# Altium project 14MV1.PrjPcb
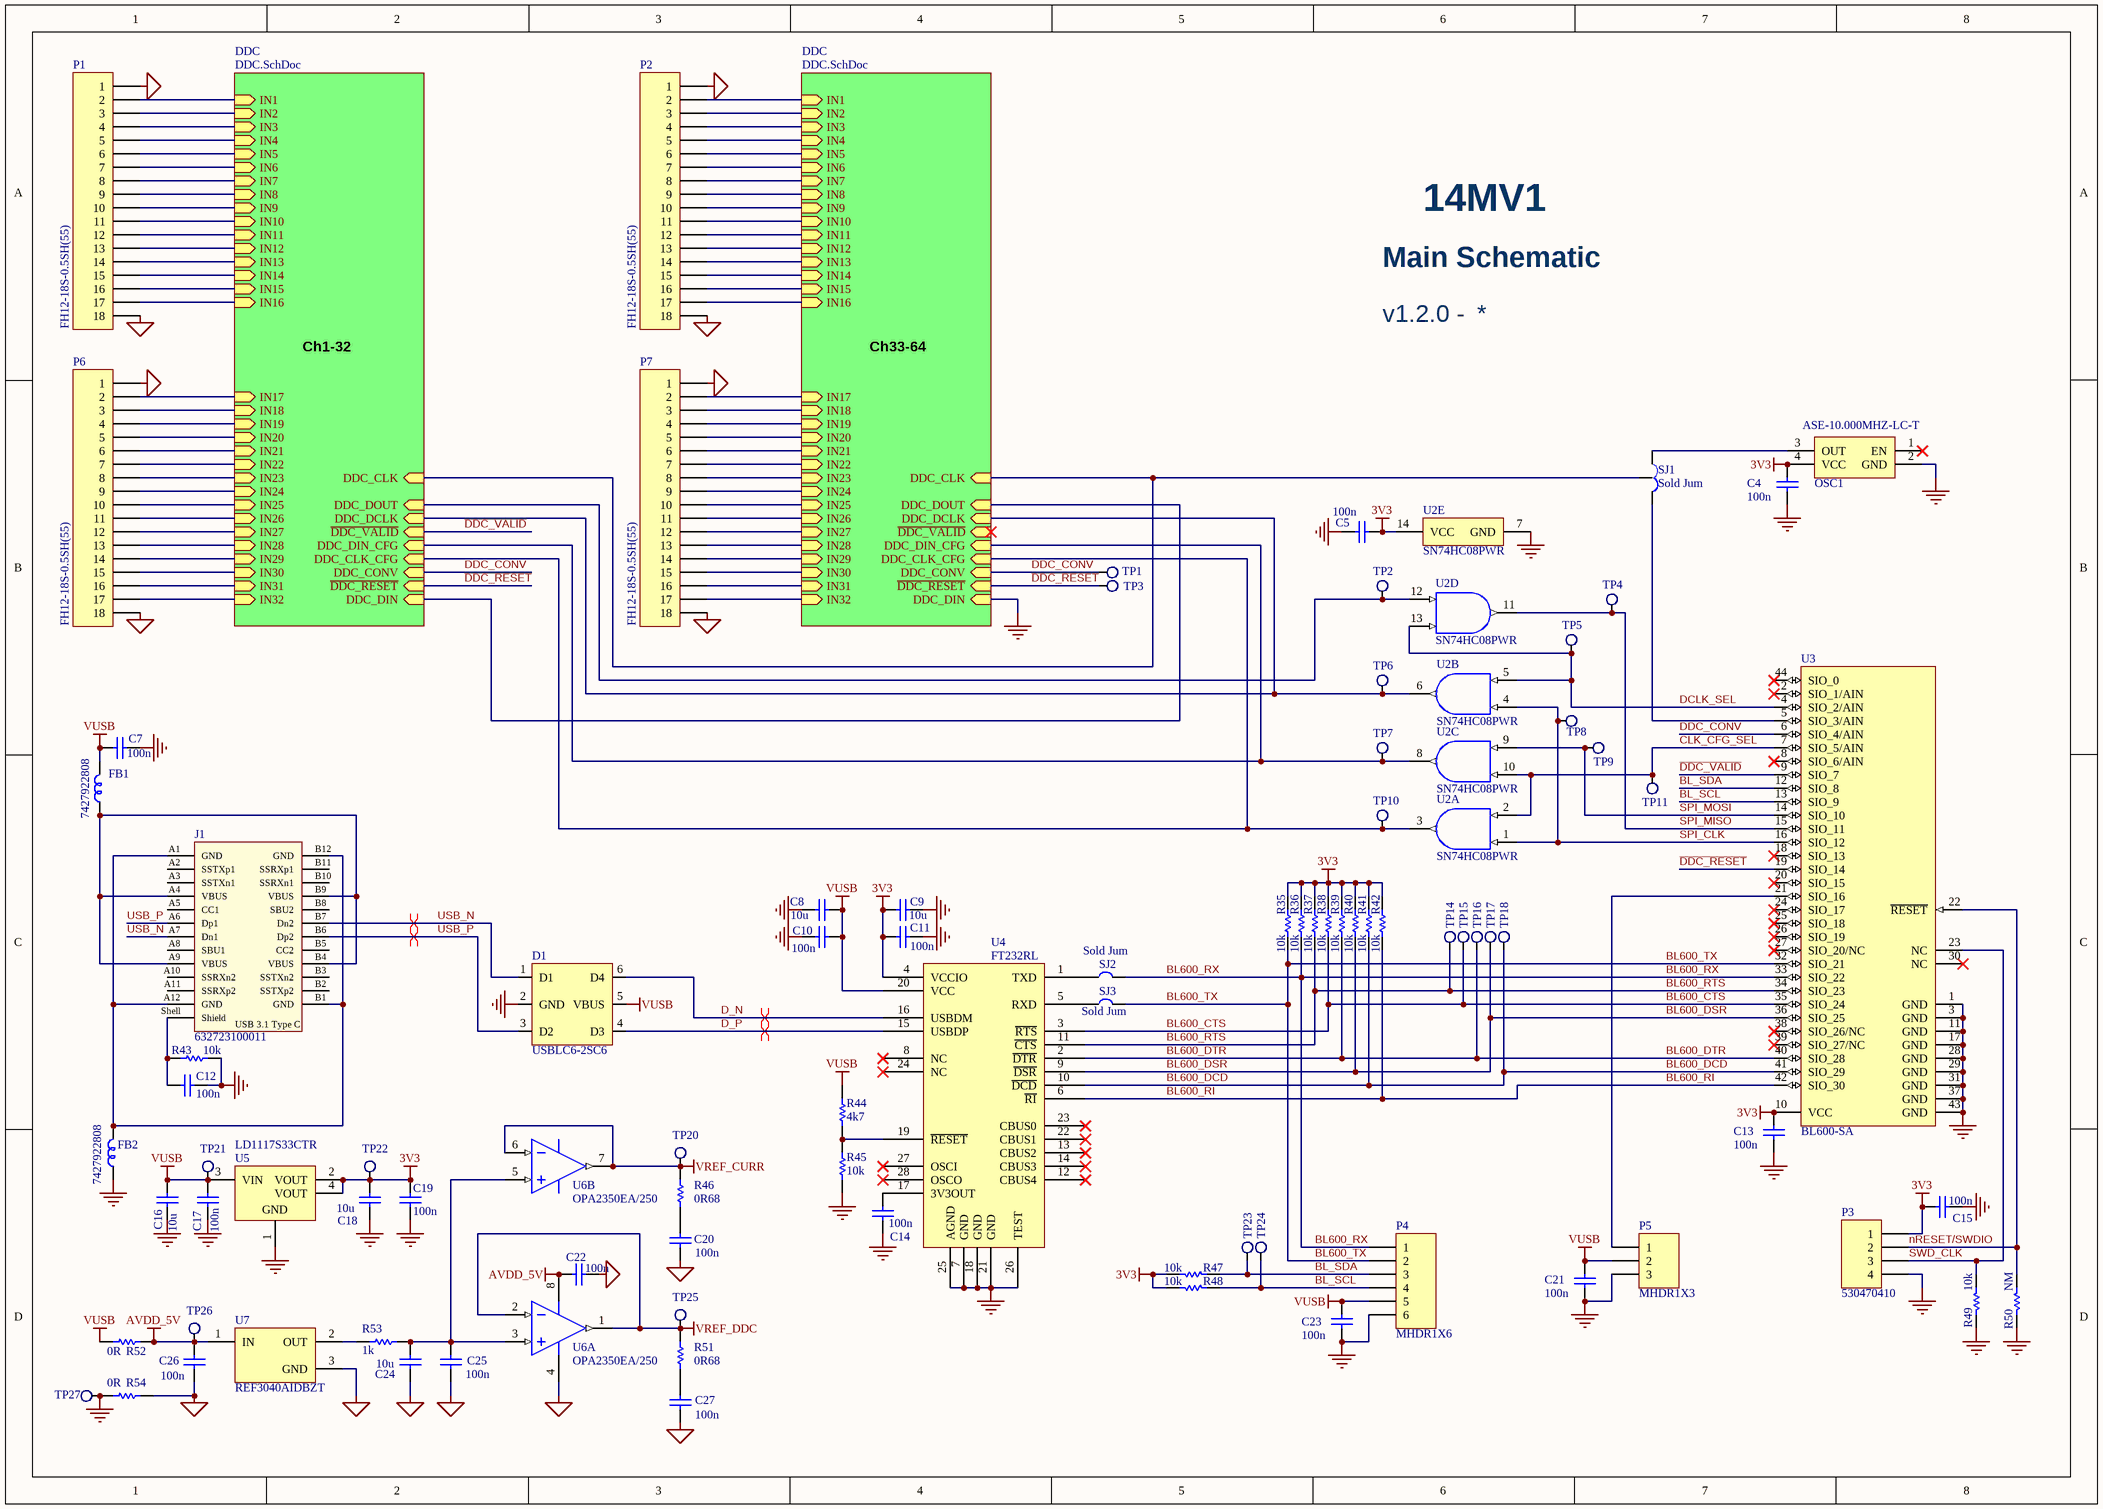
[diagram p0: 14MV1.SchDoc]
2 sheets, 166 parts. Net scope: hierarchical (ports join the sheet entries above them; power ports are global).
Board file: 14MV1.PcbDoc
Sheets:
  14MV1.SchDoc
    DDC = DDC.SchDoc
    DDC = DDC.SchDoc

## Sheet 14MV1.SchDoc
size A3

### Parts
C4  100n  [0402]
C5  100n  [0402]
C7  100n  [0402]
C8  10u  [0603]
C9  10u  [0603]
C10  100n  [0402]
C11  100n  [0402]
C12  100n  [0402]
C13  100n  [0402]
C14  100n  [0402]
C15  100n  [0402]
C16  10u  [0603]
C17  100n  [0402]
C18  10u  [0603]
C19  100n  [0402]
C20  100n  [0402]
C21  100n  [0402]
C22  100n  [0402]
C23  100n  [0402]
C24  10u  [0603]
C25  100n  [0402]
C26  100n  [0402]
C27  100n  [0402]
D1  USBLC6-2SC6  [SOT23-6]
FB1  7427922808  [0603]
FB2  7427922808  [0603]
J1  632723100011  [632723100011]
OSC1  ASE-10.000MHZ-LC-T  [XTAL_SMD3225]
P1  FH12-18S-0.5SH(55)  [FH12-18S-0.5SH(55)]
P2  FH12-18S-0.5SH(55)  [FH12-18S-0.5SH(55)]
P3  530470410  [MOLEX_4_V]
P4  MHDR1X6  [MHDR1X6]
P5  MHDR1X3  [MHDR1X3]
P6  FH12-18S-0.5SH(55)  [FH12-18S-0.5SH(55)]
P7  FH12-18S-0.5SH(55)  [FH12-18S-0.5SH(55)]
R35  10k  [0402]
R36  10k  [0402]
R37  10k  [0402]
R38  10k  [0402]
R39  10k  [0402]
R40  10k  [0402]
R41  10k  [0402]
R42  10k  [0402]
R43  10k  [0402]
R44  4k7  [0402]
R45  10k  [0402]
R46  0R68  [0402]
R47  10k  [0402]
R48  10k  [0402]
R49  10k  [0402]
R50  NM  [0402]
R51  0R68  [0402]
R52  0R  [0402]
R53  1k  [0402]
R54  0R  [0402]
SJ1  Sold Jum  [Solder_j2]
SJ2  Sold Jum  [Solder_j]
SJ3  Sold Jum  [Solder_j]
TP1  TestPoint  [PIAZZOLA]  (value not drawn)
TP2  TestPoint  [PIAZZOLA]  (value not drawn)
TP3  TestPoint  [PIAZZOLA]  (value not drawn)
TP4  TestPoint  [PIAZZOLA]  (value not drawn)
TP5  TestPoint  [PIAZZOLA]  (value not drawn)
TP6  TestPoint  [PIAZZOLA]  (value not drawn)
TP7  TestPoint  [PIAZZOLA]  (value not drawn)
TP8  TestPoint  [PIAZZOLA]  (value not drawn)
TP9  TestPoint  [PIAZZOLA]  (value not drawn)
TP10  TestPoint  [PIAZZOLA]  (value not drawn)
TP11  TestPoint  [PIAZZOLA]  (value not drawn)
TP14  TestPoint  [PIAZZOLA]  (value not drawn)
TP15  TestPoint  [PIAZZOLA]  (value not drawn)
TP16  TestPoint  [PIAZZOLA]  (value not drawn)
TP17  TestPoint  [PIAZZOLA]  (value not drawn)
TP18  TestPoint  [PIAZZOLA]  (value not drawn)
TP20  TestPoint  [PIAZZOLA]  (value not drawn)
TP21  TestPoint  [PIAZZOLA]  (value not drawn)
TP22  TestPoint  [PIAZZOLA]  (value not drawn)
TP23  TestPoint  [PIAZZOLA]  (value not drawn)
TP24  TestPoint  [PIAZZOLA]  (value not drawn)
TP25  TestPoint  [PIAZZOLA]  (value not drawn)
TP26  TestPoint  [PIAZZOLA]  (value not drawn)
TP27  TestPoint  [PIAZZOLA]  (value not drawn)
U2  SN74HC08PWR  [PW0014A_M]  (parts A,B,C,D,E of 5)
U3  BL600-SA  [LIRD-BL600-SA_V]
U4  FT232RL  [TSSOP28-W]
U5  LD1117S33CTR  [SOT-223_N]
U6  OPA2350EA/250  [DGK0008A_N]  (parts A,B of 2)
U7  REF3040AIDBZT  [DBZ0003A_M]

### Sub-sheets
DDC = DDC.SchDoc: IN1 (in), IN2 (in), IN3 (in), IN4 (in), IN5 (in), IN6 (in), IN7 (in), IN8 (in), IN9 (in), IN10 (in), IN11 (in), IN12 (in), IN13 (in), IN14 (in), IN15 (in), IN16 (in), IN17 (in), IN18 (in), IN19 (in), IN20 (in), IN21 (in), IN22 (in), IN23 (in), IN24 (in), IN25 (in), IN26 (in), IN27 (in), IN28 (in), IN29 (in), IN30 (in), IN31 (in), IN32 (in), ~{DDC_RESET} (in), DDC_CONV (in), DDC_DIN_CFG (in), DDC_CLK_CFG (in), DDC_CLK (in), DDC_DCLK (in), DDC_DIN (in), DDC_DOUT (in), ~{DDC_VALID} (in)
DDC = DDC.SchDoc: IN1 (in), IN2 (in), IN3 (in), IN4 (in), IN5 (in), IN6 (in), IN7 (in), IN8 (in), IN9 (in), IN10 (in), IN11 (in), IN12 (in), IN13 (in), IN14 (in), IN15 (in), IN16 (in), IN17 (in), IN18 (in), IN19 (in), IN20 (in), IN21 (in), IN22 (in), IN23 (in), IN24 (in), IN25 (in), IN26 (in), IN27 (in), IN28 (in), IN29 (in), IN30 (in), IN31 (in), IN32 (in), ~{DDC_RESET} (in), DDC_CONV (in), DDC_DIN_CFG (in), DDC_CLK_CFG (in), DDC_CLK (in), DDC_DCLK (in), DDC_DIN (in), DDC_DOUT (in), ~{DDC_VALID} (in)

### Nets
3V3: C4.1 C5.2 C9.1 C11.1 C13.1 C15.1 C18.1 C19.1 OSC1.4(VCC) P3.1 R35.2 R36.2 R37.2 R38.2 R39.2 R40.2 R41.2 R42.2 R47.2 R48.2 TP22.1 U2.14(VCC) U3.10(VCC) U4.4(VCCIO) U5.2(VOUT) U5.4(VOUT)
AGND: C20.2 C22.2 C24.2 C25.2 C26.2 C27.2 P1.1 P1.18 P2.1 P2.18 P6.1 P6.18 P7.1 P7.18 R54.1 U6.4(V-) U7.3(GND)
AVDD_5V: C22.1 C26.1 R52.1 TP26.1 U6.8(V+) U7.1(IN)
GND: C4.2 C5.1 C7.2 C8.2 C9.2 C10.2 C11.2 C12.2 C13.2 C14.1 C15.2 C16.2 C17.2 C18.2 C19.2 C21.2 C23.2 D1.2(GND) FB2.2 OSC1.2(GND) P3.4 P4.6 P5.3 R43.1 R45.2 R49.2 R50.2 R54.2 TP27.1 U2.7(GND) U3.1(GND) U3.3(GND) U3.11(GND) U3.17(GND) U3.28(GND) U3.29(GND) U3.31(GND) U3.37(GND) U3.43(GND) U4.7(GND) U4.18(GND) U4.21(GND) U4.25(AGND) U4.26(TEST) U5.1(GND) ; sheet DDC/DDC_DIN
VREF_CURR: R46.2 TP20.1 U6.6(IN_B-) U6.7(OUT_B)
VREF_DDC: R51.2 TP25.1 U6.1(OUT_A) U6.2(IN_A-)
VUSB: C7.1 C8.1 C10.1 C16.1 C17.1 C21.1 C23.1 D1.5(VBUS) FB1.1 P4.5 P5.2 R44.2 R52.2 TP21.1 U4.20(VCC) U5.3(VIN)
BL600_CTS: R38.1 TP15.1 U3.35(SIO_24) U4.3(~{RTS})
BL600_DCD: R41.1 TP18.1 U3.41(SIO_29) U4.10(~{DCD})
BL600_DSR: R40.1 TP17.1 U3.36(SIO_25) U4.9(~{DSR})
BL600_DTR: R39.1 TP16.1 U3.40(SIO_28) U4.2(~{DTR})
BL600_RI: R42.1 U3.42(SIO_30) U4.6(~{RI})
BL600_RTS: R37.1 TP14.1 U3.34(SIO_23) U4.11(~{CTS})
BL600_RX: P4.1 R36.1 SJ2.1 U3.33(SIO_22)
BL600_TX: P4.2 R35.1 SJ3.1 U3.32(SIO_21)
BL_SCL: P4.4 R48.1 TP24.1 U3.13(SIO_9)
BL_SDA: P4.3 R47.1 TP23.1 U3.12(SIO_8)
CLK_CFG_SEL: TP11.1 U2.2(1B) U2.10(3B) U3.7(SIO_5/AIN)
~{DDC_RESET}: TP3.1 U3.19(SIO_14) ; sheet DDC/~{DDC_RESET}, sheet DDC/~{DDC_RESET}
~{DDC_VALID}: U3.9(SIO_7) ; sheet DDC/~{DDC_VALID}
D_N: D1.6(D4) U4.16(USBDM)
D_P: D1.4(D3) U4.15(USBDP)
DCLK_SEL: TP5.1 U2.5(2B) U2.13(4B) U3.4(SIO_2/AIN)
DDC_CONV: TP1.1 U3.6(SIO_4/AIN) ; sheet DDC/DDC_CONV, sheet DDC/DDC_CONV
nRESET/SWDIO: P3.2 R50.1 U3.22(~{RESET})
SPI_CLK: TP8.1 U2.1(1A) U2.4(2A) U3.16(SIO_12)
SPI_MISO: TP4.1 U2.11(4Y) U3.15(SIO_11)
SPI_MOSI: TP9.1 U2.9(3A) U3.14(SIO_10)
SWD_CLK: P3.3 R49.1 U3.23(NC)
USB_N: D1.1(D1) J1.A7(Dn1) J1.B7(Dn2)
USB_P: D1.3(D2) J1.A6(Dp1) J1.B6(Dp2)
NetC12_1: C12.1 J1.Shell(Shield) R43.2
NetC14_2: C14.2 U4.17(3V3OUT)
NetC20_1: C20.1 R46.1
NetC24_1: C24.1 C25.1 R53.1 U6.3(IN_A+) U6.5(IN_B+)
NetC27_1: C27.1 R51.1
NetFB1_2: FB1.2 J1.A4(VBUS) J1.A9(VBUS) J1.B4(VBUS) J1.B9(VBUS)
NetFB2_1: FB2.1 J1.A1(GND) J1.A12(GND) J1.B1(GND) J1.B12(GND)
NetOSC1_3: OSC1.3(OUT) SJ1.3
NetP1_2: P1.2 ; sheet DDC/IN1
NetP1_3: P1.3 ; sheet DDC/IN2
NetP1_4: P1.4 ; sheet DDC/IN3
NetP1_5: P1.5 ; sheet DDC/IN4
NetP1_6: P1.6 ; sheet DDC/IN5
NetP1_7: P1.7 ; sheet DDC/IN6
NetP1_8: P1.8 ; sheet DDC/IN7
NetP1_9: P1.9 ; sheet DDC/IN8
NetP1_10: P1.10 ; sheet DDC/IN9
NetP1_11: P1.11 ; sheet DDC/IN10
NetP1_12: P1.12 ; sheet DDC/IN11
NetP1_13: P1.13 ; sheet DDC/IN12
NetP1_14: P1.14 ; sheet DDC/IN13
NetP1_15: P1.15 ; sheet DDC/IN14
NetP1_16: P1.16 ; sheet DDC/IN15
NetP1_17: P1.17 ; sheet DDC/IN16
NetP2_2: P2.2 ; sheet DDC/IN1
NetP2_3: P2.3 ; sheet DDC/IN2
NetP2_4: P2.4 ; sheet DDC/IN3
NetP2_5: P2.5 ; sheet DDC/IN4
NetP2_6: P2.6 ; sheet DDC/IN5
NetP2_7: P2.7 ; sheet DDC/IN6
NetP2_8: P2.8 ; sheet DDC/IN7
NetP2_9: P2.9 ; sheet DDC/IN8
NetP2_10: P2.10 ; sheet DDC/IN9
NetP2_11: P2.11 ; sheet DDC/IN10
NetP2_12: P2.12 ; sheet DDC/IN11
NetP2_13: P2.13 ; sheet DDC/IN12
NetP2_14: P2.14 ; sheet DDC/IN13
NetP2_15: P2.15 ; sheet DDC/IN14
NetP2_16: P2.16 ; sheet DDC/IN15
NetP2_17: P2.17 ; sheet DDC/IN16
NetP5_1: P5.1 U3.21(SIO_16)
NetP6_2: P6.2 ; sheet DDC/IN17
NetP6_3: P6.3 ; sheet DDC/IN18
NetP6_4: P6.4 ; sheet DDC/IN19
NetP6_5: P6.5 ; sheet DDC/IN20
NetP6_6: P6.6 ; sheet DDC/IN21
NetP6_7: P6.7 ; sheet DDC/IN22
NetP6_8: P6.8 ; sheet DDC/IN23
NetP6_9: P6.9 ; sheet DDC/IN24
NetP6_10: P6.10 ; sheet DDC/IN25
NetP6_11: P6.11 ; sheet DDC/IN26
NetP6_12: P6.12 ; sheet DDC/IN27
NetP6_13: P6.13 ; sheet DDC/IN28
NetP6_14: P6.14 ; sheet DDC/IN29
NetP6_15: P6.15 ; sheet DDC/IN30
NetP6_16: P6.16 ; sheet DDC/IN31
NetP6_17: P6.17 ; sheet DDC/IN32
NetP7_2: P7.2 ; sheet DDC/IN17
NetP7_3: P7.3 ; sheet DDC/IN18
NetP7_4: P7.4 ; sheet DDC/IN19
NetP7_5: P7.5 ; sheet DDC/IN20
NetP7_6: P7.6 ; sheet DDC/IN21
NetP7_7: P7.7 ; sheet DDC/IN22
NetP7_8: P7.8 ; sheet DDC/IN23
NetP7_9: P7.9 ; sheet DDC/IN24
NetP7_10: P7.10 ; sheet DDC/IN25
NetP7_11: P7.11 ; sheet DDC/IN26
NetP7_12: P7.12 ; sheet DDC/IN27
NetP7_13: P7.13 ; sheet DDC/IN28
NetP7_14: P7.14 ; sheet DDC/IN29
NetP7_15: P7.15 ; sheet DDC/IN30
NetP7_16: P7.16 ; sheet DDC/IN31
NetP7_17: P7.17 ; sheet DDC/IN32
NetR44_1: R44.1 R45.1 U4.19(~{RESET})
NetR53_2: R53.2 U7.2(OUT)
NetSJ1_1: SJ1.1 U3.5(SIO_3/AIN)
NetSJ1_2: SJ1.2 ; sheet DDC/DDC_CLK, sheet DDC/DDC_CLK
NetSJ2_2: SJ2.2 U4.1(TXD)
NetSJ3_2: SJ3.2 U4.5(RXD)
NetTP2_1: TP2.1 U2.12(4A) ; sheet DDC/DDC_DOUT
NetTP6_1: TP6.1 U2.6(2Y) ; sheet DDC/DDC_DCLK, sheet DDC/DDC_DCLK
NetTP7_1: TP7.1 U2.8(3Y) ; sheet DDC/DDC_DIN_CFG, sheet DDC/DDC_DIN_CFG
NetTP10_1: TP10.1 U2.3(1Y) ; sheet DDC/DDC_CLK_CFG, sheet DDC/DDC_CLK_CFG
NetU1_DDC1_D8: sheet DDC/DDC_DIN, sheet DDC/DDC_DOUT

Not connected (* = marked no-connect by the designer): J1 A2(SSTXp1) A3(SSTXn1) A5(CC1) A8(SBU1) A10(SSRXn2) A11(SSRXp2) B2(SSTXp2) B3(SSTXn2) B5(CC2) B8(SBU2) B10(SSRXn1) B11(SSRXp1); OSC1 1(EN)*; U3 2(SIO_1/AIN)* 8(SIO_6/AIN)* 18(SIO_13)* 20(SIO_15)* 24(SIO_17)* 25(SIO_18)* 26(SIO_19)* 27(SIO_20/NC)* 30(NC)* 38(SIO_26/NC)* 39(SIO_27/NC)* 44(SIO_0)*; U4 8(NC)* 12(CBUS4)* 13(CBUS2)* 14(CBUS3)* 22(CBUS1)* 23(CBUS0)* 24(NC)* 27(OSCI)* 28(OSCO)*

### Layout directives
differential pair: D_N, D_P, USB_N, USB_P

### Notes on the sheet
- 14MV1
- Main Schematic
- Ch1-32
- Ch33-64
- v1.2.0 -
- (in symbol 632723100011) USB 3.1 Type C

### Library data of the parts
C4 C5 C7 C10-C15 C17 C19-C23 C25-C27 = Cap 100nF: Capacitor X7R 50V 10%; Published: 8-Jun-2000; LatestRevisionDate: 17-Jul-2002; LatestRevisionNote: Re-released for DXP Platform.; Publisher: Altium Limited
C8 C9 C16 C18 C24 = Cap 10uF: Capacitor MLCC 25V 10%; Published: 8-Jun-2000; LatestRevisionDate: 17-Jul-2002; LatestRevisionNote: Re-released for DXP Platform.; Publisher: Altium Limited
D1 = USBUF02W6: EMI filter and line termination for USB upstream ports; Supplier 1: Digi-Key; Supplier Part Number 1: 497-5235-1-ND; Supplier 2: Farnell; Supplier Part Number 2: 1269406
FB1 FB2 = 7427922808: Ferrite bead; Supplier 1: Digi-Key; Supplier Part Number 1: 732-6114-1-ND; Supplier 2: Farnell; Supplier Part Number 2: 2467183
J1 = 632723100011: USB 3.1 Type C Receptacle Horizontal THR WR-COM; Interface Type: Type C; Sub-Family: USB 3.1; ComponentLink1Description: Manufacturer; ComponentLink1URL: http://www.we-online.de; ComponentLink2Description: Datasheet; ComponentLink2URL: http://katalog.we-online.de/em/datasheet/632723x00011.pdf; Part Number: 632723100011; Published Date: April 2017; Publisher: Wurth Elektronik; Gender: Receptacle; Type: Horizontal; Construction: THR; Supplier 1: Digi-Key; Supplier 2: Farnell; Supplier Part Number 1: 732-9617-1-ND; Supplier Part Number 2: 2984360
OSC1 = ASE-10.000MHZ-LC-T: Oscillator 10 MHz; Supplier 1: Digi-Key; Supplier Part Number 1: 535-9559-1-ND; Supplier 2: Mouser; Supplier Part Number 2: 815-ASE10.000MHZLCT
P1 P2 P6 P7 = FH12-18S-0.5SH(55): Header, 18-Pin; LatestRevisionDate: 17-Jul-2002; LatestRevisionNote: Re-released for DXP Platform.; Publisher: Altium Limited; Supplier 1: Digi-Key; Supplier 2: RSComponents; Supplier Part Number 1: HFJ118CT-ND; Supplier Part Number 2: 7388824
P3 = 530470410: Header, 4-Pin; LatestRevisionDate: 17-Jul-2002; LatestRevisionNote: Re-released for DXP Platform.; Publisher: Altium Limited; Supplier 1: Digi-Key; Supplier 2: Farnell; Supplier Part Number 1: WM1733-ND; Supplier Part Number 2: 9733060
P4 = MHDR1X6: Header, 6-Pin; LatestRevisionDate: 17-Jul-2002; LatestRevisionNote: Re-released for DXP Platform.; Publisher: Altium Limited
P5 = MHDR1X3: Header, 3-Pin; LatestRevisionDate: 17-Jul-2002; LatestRevisionNote: Re-released for DXP Platform.; Publisher: Altium Limited
R35-R43 R45 R47-R49 = Res 10k: Resistor 0.1W 1%; Published: 8-Jun-2000; Publisher: Altium Limited; Value: 10k; LatestRevisionDate: 17-Jul-2002; LatestRevisionNote: Re-released for DXP Platform.; PackageReference: AXIAL-0.3; PackageDescription: Axial Device, Thru-Hole; 2 Leads; 0.3 in Pin Spacing
R44 = Res 4k7: Resistor 0.1W 1%; Published: 8-Jun-2000; Publisher: Altium Limited; Value: 4k7; LatestRevisionDate: 17-Jul-2002; LatestRevisionNote: Re-released for DXP Platform.; PackageReference: AXIAL-0.3; PackageDescription: Axial Device, Thru-Hole; 2 Leads; 0.3 in Pin Spacing
R46 R51 = Res 0R68: Resistor 0.1W 1%; Published: 8-Jun-2000; Publisher: Altium Limited; Value: 0R68; LatestRevisionDate: 17-Jul-2002; LatestRevisionNote: Re-released for DXP Platform.; PackageReference: AXIAL-0.3; PackageDescription: Axial Device, Thru-Hole; 2 Leads; 0.3 in Pin Spacing
R50 = Res NM: Resistor 0.1W 1%; Fitted: NO; Published: 8-Jun-2000; Revision: July-2002: Re-released for DXP Platform.; Publisher: Altium Limited; Value: NM
R52 R54 = Res 0R: Resistor 0.1W 1%; Published: 8-Jun-2000; Publisher: Altium Limited; Value: 0R; LatestRevisionDate: 17-Jul-2002; LatestRevisionNote: Re-released for DXP Platform.; PackageReference: AXIAL-0.3; PackageDescription: Axial Device, Thru-Hole; 2 Leads; 0.3 in Pin Spacing
R53 = Res 1k: Resistor 0.1W 1%; Published: 8-Jun-2000; Publisher: Altium Limited; Value: 1k; LatestRevisionDate: 17-Jul-2002; LatestRevisionNote: Re-released for DXP Platform.; PackageReference: AXIAL-0.3; PackageDescription: Axial Device, Thru-Hole; 2 Leads; 0.3 in Pin Spacing
SJ1 = SJ2: Double solder jumper
SJ2 SJ3 = SJ: Solder Jumper
U2 = SN74HC08: Quadruple 2-Input Positive-AND Gates, PW0014A, LARGE T&R; Manufacturer: Texas Instruments; F @ Nom Voltage(Max)(Mhz): 70; Schmitt Trigger: No; Rating: Catalog; Input Type: CMOS; Voltage(Nom)(V): 5; VCC(Min)(V): 2; tpd @ Nom Voltage(Max)(ns): 28; Bits(#): 4; Technology Family: HC; VCC(Max)(V): 6; ICC @ Nom Voltage(Max)(mA): 0.02; Output Type: CMOS; DatasheetVersion: SCLS081F; Generic Part Number: SN74HC08; PackageReference: PW0014A; Operating Temperature Range(C): -40 to 85; Manufacturer Part Number: SN74HC08PWR; Supplier 1: Digi-Key; Supplier 2: Farnell; Supplier Part Number 1: 296-8210-1-ND; Supplier Part Number 2: 3006560
U3 = BL600-SA: Single Mode Bluetooth Low Energy (BLE) Module Integrated Antenna, 1.8 to 3.6 V, -25 to 75 degC, 44-Pin SMD, RoHS, Tray; Manufacturer: Laird Wireless; Bluetooth Version: Bluetooth4.0; Data Rate: 1Mbps; Supply Voltage Max: 3.6V; Supply Voltage Min: 1.8V; SVHC: NoSVHC(17-Dec-2014); Product Range: BL600Series; Receive Sensitivity: -91dBm; Signal Range Max: 100m; Bluetooth Class: Class2; Package Reference: BL600-SA; Datasheet Version: Rev. 3.0, 04/2015; Operating Temperature Max: 75°C; Operating Temperature Min: -25°C; Datasheet URL: http://cdn.lairdtech.com/home/brandworld/files/BL600%20Hardware%20Integration%20Guide.pdf; Package Description: 44-Pin Surface Mount Device, Body 19 x 12.5 mm, Pitch 0.8 mm, Height 3.27 mm; Manufacturer URL: https://www.lairdtech.com/; Mounting Technology: SurfaceMount; Manufacturer Part Number: BL600-SA; Supplier 1: Digi-Key; Supplier 2: Farnell; Supplier Part Number 1: BL600-SA-ND; Supplier Part Number 2: 2321469
U4 = FT232RL: USB  to  serial  UART   interface; Supplier 1: Digi-Key; Supplier Part Number 1: 768-1007-1-ND; Supplier 2: Farnell; Supplier Part Number 2: 1146032
U5 = LD1117: Fixed Low Drop Positive Voltage Regulator, 3.3V, 4-Pin SOT-223, Tape and Reel; Manufacturer: STMicroelectronics; ComponentLink1URL: http://www.st.com; PackageVersion: 2010; ComponentLink1Description: Manufacturer URL; DatasheetVersion: 1/11/2011; ComponentLink2URL: http://www.st.com/internet/com/TECHNICAL_RESOURCES/TECHNICAL_LITERATURE/DATASHEET/CD00000544.pdf; PackageReference: SOT-223; ComponentLink2Description: Datasheet; PackageDescription: 4-Pin SOT-223 Package, 6.5 x 3.5 mm Body, 2.3 mm Pitch, 7 mm Lead Span; Manufacturer Part Number: LD1117S33CTR; Supplier 1: Digi-Key; Supplier 2: Farnell; Supplier Part Number 1: 497-1241-1-ND; Supplier Part Number 2: 1467779
U6 = OPA2350: High-Speed, Single-Supply, Rail-to-Rail Operational Amplifier MicroAmplifier(TM) Series, 2.7 to 5.5 V, -40 to 85 degC, 8-pin SOP (DGK8), Green (RoHS & no Sb/Br); Manufacturer: Texas Instruments; Number of Channels: 2; Vn at 1kHz(Typ)(nV/rtHz): 18; Offset Drift(Typ)(uV/C): 4; Slew Rate(Typ)(V/us): 22; Iq per channel(Max)(mA): 8.5; CMRR(Min)(dB): 74; Total Supply Voltage(Max)(+5V is 5, +/-5V is 10): 5.5; Vio (25C)(Max)(mV): 1; Total Supply Voltage(Min)(+5V is 5, +/-5V is 10): 2.7; IIB(Max)(pA): 10; Sub Family: Low Input Bias Current Amp (<=10pA), Low Offset Voltage Amplifier (<=500uV), Low Supply Voltage Amplifier (<=2.7V), Precision Amplifier; ComponentLink3URL: http://www.ti.com/litv/pdf/mpds028d; ComponentLink2URL: http://www.ti.com/general/docs/lit/getliterature.tsp?genericPartNumber=OPA2350&fileType=pdf; ComponentLink3Description: Package Specification; Eco-Plan: Green (RoHS & no Sb/Br); ComponentLink2Description: Datasheet; PackageVersion: 4073329/E, 05/2006; PackageDescription: 8-Pin Thin Small Outline, Body 3 x 3 mm, Pitch 0.65 mm; PackageReference: DGK0008A; Mounting Technology: Surface Mount; ComponentLink1Description: Manufacturer URL; PartNumber: OPA2350EA/250; Code_JEDEC: MO-187; ComponentLink1URL: http://www.ti.com/; DatasheetVersion: SBOS099C; Manufacturer Part Number: OPA2350EA/250; Supplier 1: Digi-Key; Supplier 2: Farnell; Supplier Part Number 1: OPA2350EACT-ND; Supplier Part Number 2: 3117460
U7 = REF3040: 4.096 V, 50 ppm / degC, 50 uA Series (Bandgap) Voltage Reference, -40 to 125 degC, 3-pin SOT-23 (DBZ), Green (RoHS & no Sb/Br); Manufacturer: Texas Instruments; Temp Coeff(Max)(ppm/ degree C): 50; SubFamily: Series Voltage Reference; Temp Coeff(Typ)(ppm/ degree C): 20; Initial Accuracy @ 25/deg C(%): 0.2; VI(Max)(V): 5.5; VO(V): 4.096; VI(Min)(V): 4.097; Rating: Catalog; PartNumber: REF3040AIDBZT; ComponentLink3Description: Package Specification; Iq(Max)(uA): 50; PackageVersion: 4203227/B; DatasheetVersion: SBVS032F; PackageReference: DBZ0003A; ComponentLink1URL: http://www.ti.com/; PackageDescription: 3-Pin Plastic Small Outline, Body 2.92 x 1.3 mm, Pitch 0.95 mm; Mounting Technology: Surface Mount; Eco-Plan: Green (RoHS & no Sb/Br); ComponentLink2URL: http://www.ti.com/general/docs/lit/getliterature.tsp?genericPartNumber=REF3040&fileType=pdf; Code_JEDEC: TO-236; ComponentLink1Description: Manufacturer URL; ComponentLink3URL: http://www.ti.com/litv/pdf/mpds108a; ComponentLink2Description: Datasheet; Manufacturer Part Number: REF3040AIDBZT; Supplier 1: Digi-Key; Supplier 2: Farnell; Supplier Part Number 1: REF3040AIDBZTCT-ND; Supplier Part Number 2: 3124532

## Sheet DDC.SchDoc
size A4
Used 2 times, as channels DDC, DDC. Parts and nets are listed once, with the designators drawn on the sheet.
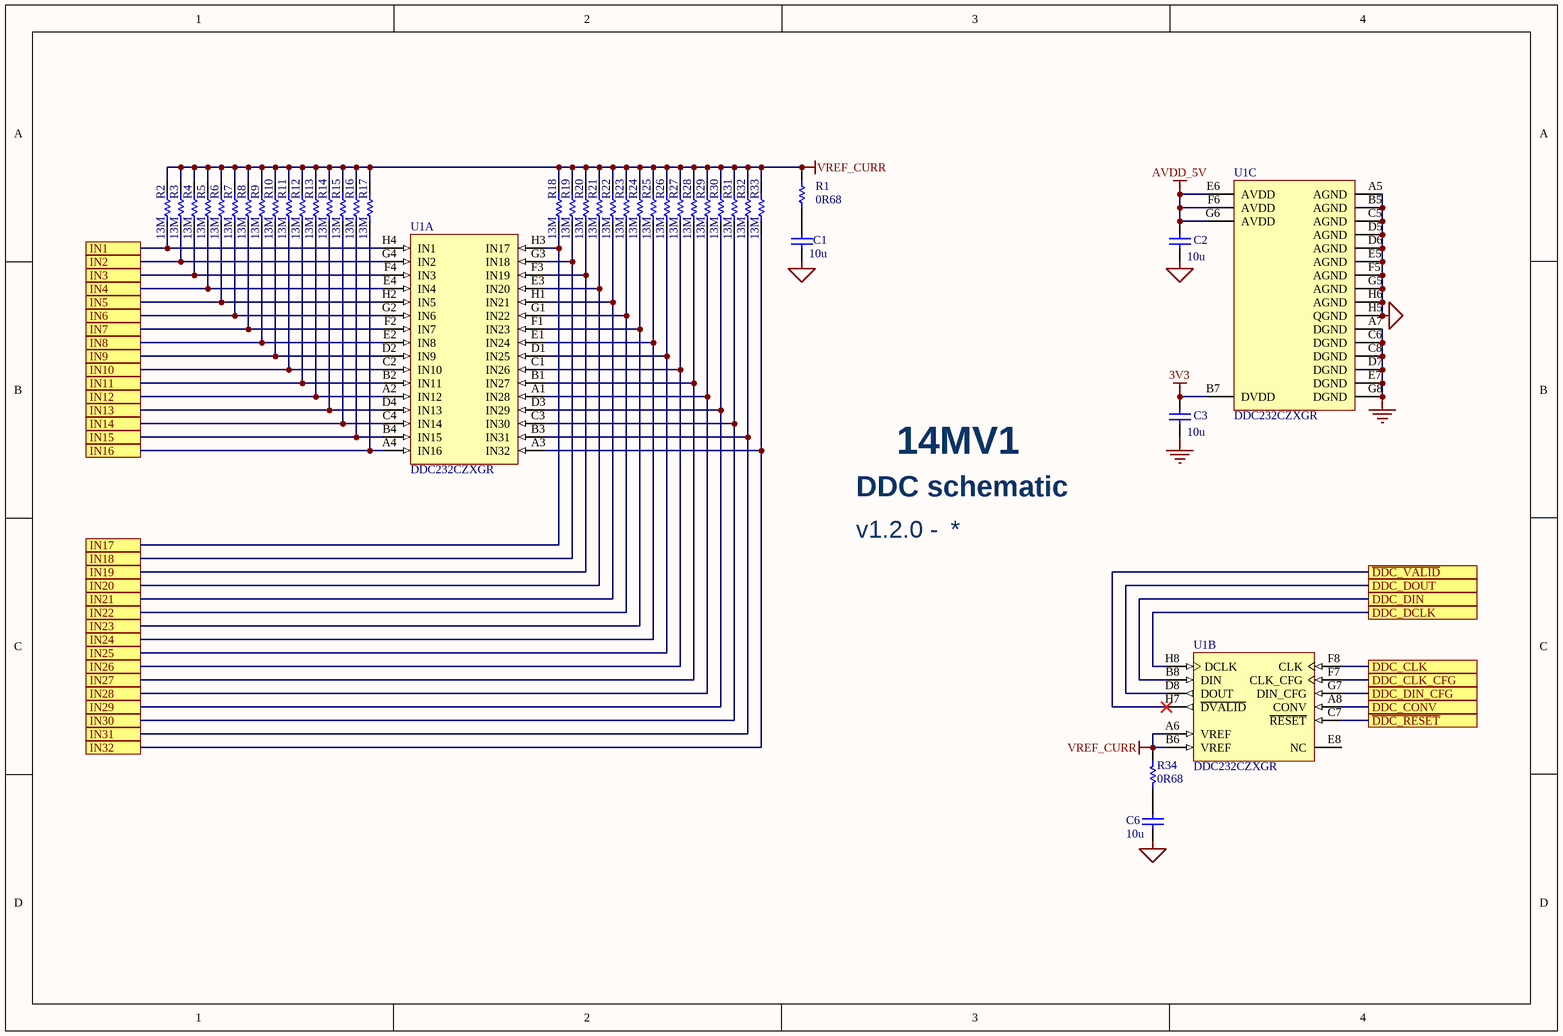
[diagram p1: DDC.SchDoc]

### Parts
C1  10u  [0603]
C2  10u  [0603]
C3  10u  [0603]
C6  10u  [0603]
R1  0R68  [0402]
R2  13M  [0402]
R3  13M  [0402]
R4  13M  [0402]
R5  13M  [0402]
R6  13M  [0402]
R7  13M  [0402]
R8  13M  [0402]
R9  13M  [0402]
R10  13M  [0402]
R11  13M  [0402]
R12  13M  [0402]
R13  13M  [0402]
R14  13M  [0402]
R15  13M  [0402]
R16  13M  [0402]
R17  13M  [0402]
R18  13M  [0402]
R19  13M  [0402]
R20  13M  [0402]
R21  13M  [0402]
R22  13M  [0402]
R23  13M  [0402]
R24  13M  [0402]
R25  13M  [0402]
R26  13M  [0402]
R27  13M  [0402]
R28  13M  [0402]
R29  13M  [0402]
R30  13M  [0402]
R31  13M  [0402]
R32  13M  [0402]
R33  13M  [0402]
R34  0R68  [0402]
U1  DDC232CZXGR  [TI-ZXG64]  (parts A,B,C of 3)

### Ports
DDC_CLK, DDC_CLK_CFG, DDC_CONV, DDC_DCLK, DDC_DIN, DDC_DIN_CFG, DDC_DOUT, IN1, IN2, IN3, IN4, IN5, IN6, IN7, IN8, IN9, IN10, IN11, IN12, IN13, IN14, IN15, IN16, IN17, IN18, IN19, IN20, IN21, IN22, IN23, IN24, IN25, IN26, IN27, IN28, IN29, IN30, IN31, IN32, ~{DDC_RESET}, ~{DDC_VALID}

### Nets
3V3: C3.2 U1.B7(DVDD)
AGND: C1.2 C2.1 C6.2 U1.A5(AGND) U1.B5(AGND) U1.C5(AGND) U1.D5(AGND) U1.D6(AGND) U1.E5(AGND) U1.F5(AGND) U1.G5(AGND) U1.H5(QGND) U1.H6(AGND)
AVDD_5V: C2.2 U1.E6(AVDD) U1.F6(AVDD) U1.G6(AVDD)
GND: C3.1 U1.A7(DGND) U1.C6(DGND) U1.C8(DGND) U1.D7(DGND) U1.E7(DGND) U1.G8(DGND)
VREF_CURR: R1.2 R2.2 R3.2 R4.2 R5.2 R6.2 R7.2 R8.2 R9.2 R10.2 R11.2 R12.2 R13.2 R14.2 R15.2 R16.2 R17.2 R18.2 R19.2 R20.2 R21.2 R22.2 R23.2 R24.2 R25.2 R26.2 R27.2 R28.2 R29.2 R30.2 R31.2 R32.2 R33.2 R34.2 U1.A6(VREF) U1.B6(VREF)
~{DDC_RESET}: U1.C7(~{RESET}) ; port ~{DDC_RESET}
~{DDC_VALID}: U1.H7(~{DVALID}) ; port ~{DDC_VALID}
DDC_CLK: U1.F8(CLK) ; port DDC_CLK
DDC_CLK_CFG: U1.F7(CLK_CFG) ; port DDC_CLK_CFG
DDC_CONV: U1.A8(CONV) ; port DDC_CONV
DDC_DCLK: U1.H8(DCLK) ; port DDC_DCLK
DDC_DIN: U1.B8(DIN) ; port DDC_DIN
DDC_DIN_CFG: U1.G7(DIN_CFG) ; port DDC_DIN_CFG
DDC_DOUT: U1.D8(DOUT) ; port DDC_DOUT
IN1: R2.1 U1.H4(IN1) ; port IN1
IN2: R3.1 U1.G4(IN2) ; port IN2
IN3: R4.1 U1.F4(IN3) ; port IN3
IN4: R5.1 U1.E4(IN4) ; port IN4
IN5: R6.1 U1.H2(IN5) ; port IN5
IN6: R7.1 U1.G2(IN6) ; port IN6
IN7: R8.1 U1.F2(IN7) ; port IN7
IN8: R9.1 U1.E2(IN8) ; port IN8
IN9: R10.1 U1.D2(IN9) ; port IN9
IN10: R11.1 U1.C2(IN10) ; port IN10
IN11: R12.1 U1.B2(IN11) ; port IN11
IN12: R13.1 U1.A2(IN12) ; port IN12
IN13: R14.1 U1.D4(IN13) ; port IN13
IN14: R15.1 U1.C4(IN14) ; port IN14
IN15: R16.1 U1.B4(IN15) ; port IN15
IN16: R17.1 U1.A4(IN16) ; port IN16
IN17: R18.1 U1.H3(IN17) ; port IN17
IN18: R19.1 U1.G3(IN18) ; port IN18
IN19: R20.1 U1.F3(IN19) ; port IN19
IN20: R21.1 U1.E3(IN20) ; port IN20
IN21: R22.1 U1.H1(IN21) ; port IN21
IN22: R23.1 U1.G1(IN22) ; port IN22
IN23: R24.1 U1.F1(IN23) ; port IN23
IN24: R25.1 U1.E1(IN24) ; port IN24
IN25: R26.1 U1.D1(IN25) ; port IN25
IN26: R27.1 U1.C1(IN26) ; port IN26
IN27: R28.1 U1.B1(IN27) ; port IN27
IN28: R29.1 U1.A1(IN28) ; port IN28
IN29: R30.1 U1.D3(IN29) ; port IN29
IN30: R31.1 U1.C3(IN30) ; port IN30
IN31: R32.1 U1.B3(IN31) ; port IN31
IN32: R33.1 U1.A3(IN32) ; port IN32
NetC1_1: C1.1 R1.1
NetC6_1: C6.1 R34.1

Not connected (* = marked no-connect by the designer): U1 E8(NC)

### Channels
DDC: designators end in _DDC2; ports DDC_CLK=NetSJ1_2 DDC_CLK_CFG=NetTP10_1 DDC_CONV=DDC_CONV DDC_DCLK=NetTP6_1 DDC_DIN=NetU1_DDC1_D8 DDC_DIN_CFG=NetTP7_1 DDC_DOUT=NetTP2_1 IN1=NetP1_2 IN2=NetP1_3 IN3=NetP1_4 IN4=NetP1_5 IN5=NetP1_6 IN6=NetP1_7 IN7=NetP1_8 IN8=NetP1_9 IN9=NetP1_10 IN10=NetP1_11 IN11=NetP1_12 IN12=NetP1_13 IN13=NetP1_14 IN14=NetP1_15 IN15=NetP1_16 IN16=NetP1_17 IN17=NetP6_2 IN18=NetP6_3 IN19=NetP6_4 IN20=NetP6_5 IN21=NetP6_6 IN22=NetP6_7 IN23=NetP6_8 IN24=NetP6_9 IN25=NetP6_10 IN26=NetP6_11 IN27=NetP6_12 IN28=NetP6_13 IN29=NetP6_14 IN30=NetP6_15 IN31=NetP6_16 IN32=NetP6_17 ~{DDC_RESET}=~{DDC_RESET} ~{DDC_VALID}=~{DDC_VALID}
DDC: designators end in _DDC1; ports DDC_CLK=NetSJ1_2 DDC_CLK_CFG=NetTP10_1 DDC_CONV=DDC_CONV DDC_DCLK=NetTP6_1 DDC_DIN=GND DDC_DIN_CFG=NetTP7_1 DDC_DOUT=NetU1_DDC1_D8 IN1=NetP2_2 IN2=NetP2_3 IN3=NetP2_4 IN4=NetP2_5 IN5=NetP2_6 IN6=NetP2_7 IN7=NetP2_8 IN8=NetP2_9 IN9=NetP2_10 IN10=NetP2_11 IN11=NetP2_12 IN12=NetP2_13 IN13=NetP2_14 IN14=NetP2_15 IN15=NetP2_16 IN16=NetP2_17 IN17=NetP7_2 IN18=NetP7_3 IN19=NetP7_4 IN20=NetP7_5 IN21=NetP7_6 IN22=NetP7_7 IN23=NetP7_8 IN24=NetP7_9 IN25=NetP7_10 IN26=NetP7_11 IN27=NetP7_12 IN28=NetP7_13 IN29=NetP7_14 IN30=NetP7_15 IN31=NetP7_16 IN32=NetP7_17 ~{DDC_RESET}=~{DDC_RESET} ~{DDC_VALID}=NetU1_DDC1_H7

### Notes on the sheet
- DDC schematic
- 14MV1
- v1.2.0 -

### Library data of the parts
C1-C3 C6 = Cap 10uF: Capacitor MLCC 25V 10%; Published: 8-Jun-2000; LatestRevisionDate: 17-Jul-2002; LatestRevisionNote: Re-released for DXP Platform.; Publisher: Altium Limited
R1 R34 = Res 0R68: Resistor 0.1W 1%; Published: 8-Jun-2000; Publisher: Altium Limited; Value: 0R68; LatestRevisionDate: 17-Jul-2002; LatestRevisionNote: Re-released for DXP Platform.; PackageReference: AXIAL-0.3; PackageDescription: Axial Device, Thru-Hole; 2 Leads; 0.3 in Pin Spacing
R2-R33 = Res 13M: Resistor 0.1W 1%; Published: 8-Jun-2000; Publisher: Altium Limited; Value: 13M; LatestRevisionDate: 17-Jul-2002; LatestRevisionNote: Re-released for DXP Platform.; PackageReference: AXIAL-0.3; PackageDescription: Axial Device, Thru-Hole; 2 Leads; 0.3 in Pin Spacing
U1 = DDC232: 32 Channel Current-Input 20-Bit ADC, 0 to 70 degC, 64-pin BGA (ZXG64), Green (RoHS & no Sb/Br); Manufacturer: Texas Instruments; Resolution(Bits): 20; Analog Voltage AV/DD(Max)(V): 5.25; Digital Supply(Max)(V): 3.6; Architecture: Delta-Sigma; Digital Supply(Min)(V): 2.7; Sample Rate (max)(SPS): 3.125k; # Input Channels: 32; SubFamily: Low Power, 8-Bit, Dual 1.5 GSPS or Single 3.0 GSPS A/D Converter; Analog Voltage AV/DD(Min)(V): 4.75; ComponentLink3URL: http://www.ti.com/litv/pdf/mpbg581; ComponentLink1URL: http://www.ti.com/; ComponentLink2Description: Datasheet; PackageDescription: 64-Pin Plastic Ball Grid Array, Body 8 x 8 mm, Pitch 0.8 mm; ComponentLink2URL: http://www.ti.com/general/docs/lit/getliterature.tsp?genericPartNumber=DDC232&fileType=pdf; PartNumber: DDC232CZXGR; Eco-Plan: Green (RoHS & no Sb/Br); Mounting Technology: Surface Mount; PackageVersion: 4206838/A, 02/2005; PackageReference: ZXG64; ComponentLink1Description: Manufacturer URL; DatasheetVersion: SBAS331D; ComponentLink3Description: Package Specification; Manufacturer Part Number: DDC232CZXGR; Supplier 1: Digi-Key; Supplier Part Number 1: 296-23858-1-ND

## Nets that join several sheets
3V3: 14MV1 (26 pins), DDC (C3_DDC2.2 U1_DDC2.B7), DDC (C3_DDC1.2 U1_DDC1.B7)
AGND: 14MV1 (17 pins), DDC (13 pins), DDC (13 pins)
AVDD_5V: 14MV1 (6 pins), DDC (C2_DDC2.2 U1_DDC2.E6 U1_DDC2.F6 U1_DDC2.G6), DDC (C2_DDC1.2 U1_DDC1.E6 U1_DDC1.F6 U1_DDC1.G6)
GND: 14MV1 (45 pins), DDC (7 pins), DDC (8 pins)
VREF_CURR: 14MV1 (R46.2 TP20.1 U6.6 U6.7), DDC (36 pins), DDC (36 pins)
~{DDC_RESET}: 14MV1 (TP3.1 U3.19), DDC (U1_DDC2.C7), DDC (U1_DDC1.C7)
~{DDC_VALID}: 14MV1 (U3.9), DDC (U1_DDC2.H7)
DDC_CONV: 14MV1 (TP1.1 U3.6), DDC (U1_DDC2.A8), DDC (U1_DDC1.A8)
NetP1_2: 14MV1 (P1.2), DDC (R2_DDC2.1 U1_DDC2.H4)
NetP1_3: 14MV1 (P1.3), DDC (R3_DDC2.1 U1_DDC2.G4)
NetP1_4: 14MV1 (P1.4), DDC (R4_DDC2.1 U1_DDC2.F4)
NetP1_5: 14MV1 (P1.5), DDC (R5_DDC2.1 U1_DDC2.E4)
NetP1_6: 14MV1 (P1.6), DDC (R6_DDC2.1 U1_DDC2.H2)
NetP1_7: 14MV1 (P1.7), DDC (R7_DDC2.1 U1_DDC2.G2)
NetP1_8: 14MV1 (P1.8), DDC (R8_DDC2.1 U1_DDC2.F2)
NetP1_9: 14MV1 (P1.9), DDC (R9_DDC2.1 U1_DDC2.E2)
NetP1_10: 14MV1 (P1.10), DDC (R10_DDC2.1 U1_DDC2.D2)
NetP1_11: 14MV1 (P1.11), DDC (R11_DDC2.1 U1_DDC2.C2)
NetP1_12: 14MV1 (P1.12), DDC (R12_DDC2.1 U1_DDC2.B2)
NetP1_13: 14MV1 (P1.13), DDC (R13_DDC2.1 U1_DDC2.A2)
NetP1_14: 14MV1 (P1.14), DDC (R14_DDC2.1 U1_DDC2.D4)
NetP1_15: 14MV1 (P1.15), DDC (R15_DDC2.1 U1_DDC2.C4)
NetP1_16: 14MV1 (P1.16), DDC (R16_DDC2.1 U1_DDC2.B4)
NetP1_17: 14MV1 (P1.17), DDC (R17_DDC2.1 U1_DDC2.A4)
NetP2_2: 14MV1 (P2.2), DDC (R2_DDC1.1 U1_DDC1.H4)
NetP2_3: 14MV1 (P2.3), DDC (R3_DDC1.1 U1_DDC1.G4)
NetP2_4: 14MV1 (P2.4), DDC (R4_DDC1.1 U1_DDC1.F4)
NetP2_5: 14MV1 (P2.5), DDC (R5_DDC1.1 U1_DDC1.E4)
NetP2_6: 14MV1 (P2.6), DDC (R6_DDC1.1 U1_DDC1.H2)
NetP2_7: 14MV1 (P2.7), DDC (R7_DDC1.1 U1_DDC1.G2)
NetP2_8: 14MV1 (P2.8), DDC (R8_DDC1.1 U1_DDC1.F2)
NetP2_9: 14MV1 (P2.9), DDC (R9_DDC1.1 U1_DDC1.E2)
NetP2_10: 14MV1 (P2.10), DDC (R10_DDC1.1 U1_DDC1.D2)
NetP2_11: 14MV1 (P2.11), DDC (R11_DDC1.1 U1_DDC1.C2)
NetP2_12: 14MV1 (P2.12), DDC (R12_DDC1.1 U1_DDC1.B2)
NetP2_13: 14MV1 (P2.13), DDC (R13_DDC1.1 U1_DDC1.A2)
NetP2_14: 14MV1 (P2.14), DDC (R14_DDC1.1 U1_DDC1.D4)
NetP2_15: 14MV1 (P2.15), DDC (R15_DDC1.1 U1_DDC1.C4)
NetP2_16: 14MV1 (P2.16), DDC (R16_DDC1.1 U1_DDC1.B4)
NetP2_17: 14MV1 (P2.17), DDC (R17_DDC1.1 U1_DDC1.A4)
NetP6_2: 14MV1 (P6.2), DDC (R18_DDC2.1 U1_DDC2.H3)
NetP6_3: 14MV1 (P6.3), DDC (R19_DDC2.1 U1_DDC2.G3)
NetP6_4: 14MV1 (P6.4), DDC (R20_DDC2.1 U1_DDC2.F3)
NetP6_5: 14MV1 (P6.5), DDC (R21_DDC2.1 U1_DDC2.E3)
NetP6_6: 14MV1 (P6.6), DDC (R22_DDC2.1 U1_DDC2.H1)
NetP6_7: 14MV1 (P6.7), DDC (R23_DDC2.1 U1_DDC2.G1)
NetP6_8: 14MV1 (P6.8), DDC (R24_DDC2.1 U1_DDC2.F1)
NetP6_9: 14MV1 (P6.9), DDC (R25_DDC2.1 U1_DDC2.E1)
NetP6_10: 14MV1 (P6.10), DDC (R26_DDC2.1 U1_DDC2.D1)
NetP6_11: 14MV1 (P6.11), DDC (R27_DDC2.1 U1_DDC2.C1)
NetP6_12: 14MV1 (P6.12), DDC (R28_DDC2.1 U1_DDC2.B1)
NetP6_13: 14MV1 (P6.13), DDC (R29_DDC2.1 U1_DDC2.A1)
NetP6_14: 14MV1 (P6.14), DDC (R30_DDC2.1 U1_DDC2.D3)
NetP6_15: 14MV1 (P6.15), DDC (R31_DDC2.1 U1_DDC2.C3)
NetP6_16: 14MV1 (P6.16), DDC (R32_DDC2.1 U1_DDC2.B3)
NetP6_17: 14MV1 (P6.17), DDC (R33_DDC2.1 U1_DDC2.A3)
NetP7_2: 14MV1 (P7.2), DDC (R18_DDC1.1 U1_DDC1.H3)
NetP7_3: 14MV1 (P7.3), DDC (R19_DDC1.1 U1_DDC1.G3)
NetP7_4: 14MV1 (P7.4), DDC (R20_DDC1.1 U1_DDC1.F3)
NetP7_5: 14MV1 (P7.5), DDC (R21_DDC1.1 U1_DDC1.E3)
NetP7_6: 14MV1 (P7.6), DDC (R22_DDC1.1 U1_DDC1.H1)
NetP7_7: 14MV1 (P7.7), DDC (R23_DDC1.1 U1_DDC1.G1)
NetP7_8: 14MV1 (P7.8), DDC (R24_DDC1.1 U1_DDC1.F1)
NetP7_9: 14MV1 (P7.9), DDC (R25_DDC1.1 U1_DDC1.E1)
NetP7_10: 14MV1 (P7.10), DDC (R26_DDC1.1 U1_DDC1.D1)
NetP7_11: 14MV1 (P7.11), DDC (R27_DDC1.1 U1_DDC1.C1)
NetP7_12: 14MV1 (P7.12), DDC (R28_DDC1.1 U1_DDC1.B1)
NetP7_13: 14MV1 (P7.13), DDC (R29_DDC1.1 U1_DDC1.A1)
NetP7_14: 14MV1 (P7.14), DDC (R30_DDC1.1 U1_DDC1.D3)
NetP7_15: 14MV1 (P7.15), DDC (R31_DDC1.1 U1_DDC1.C3)
NetP7_16: 14MV1 (P7.16), DDC (R32_DDC1.1 U1_DDC1.B3)
NetP7_17: 14MV1 (P7.17), DDC (R33_DDC1.1 U1_DDC1.A3)
NetSJ1_2: 14MV1 (SJ1.2), DDC (U1_DDC2.F8), DDC (U1_DDC1.F8)
NetTP2_1: 14MV1 (TP2.1 U2.12), DDC (U1_DDC2.D8)
NetTP6_1: 14MV1 (TP6.1 U2.6), DDC (U1_DDC2.H8), DDC (U1_DDC1.H8)
NetTP7_1: 14MV1 (TP7.1 U2.8), DDC (U1_DDC2.G7), DDC (U1_DDC1.G7)
NetTP10_1: 14MV1 (TP10.1 U2.3), DDC (U1_DDC2.F7), DDC (U1_DDC1.F7)
NetU1_DDC1_D8: DDC (U1_DDC2.B8), DDC (U1_DDC1.D8)